# Altium schematic sheet 31_Radar_VPP_service.SchDoc
size 289 x 396 mm
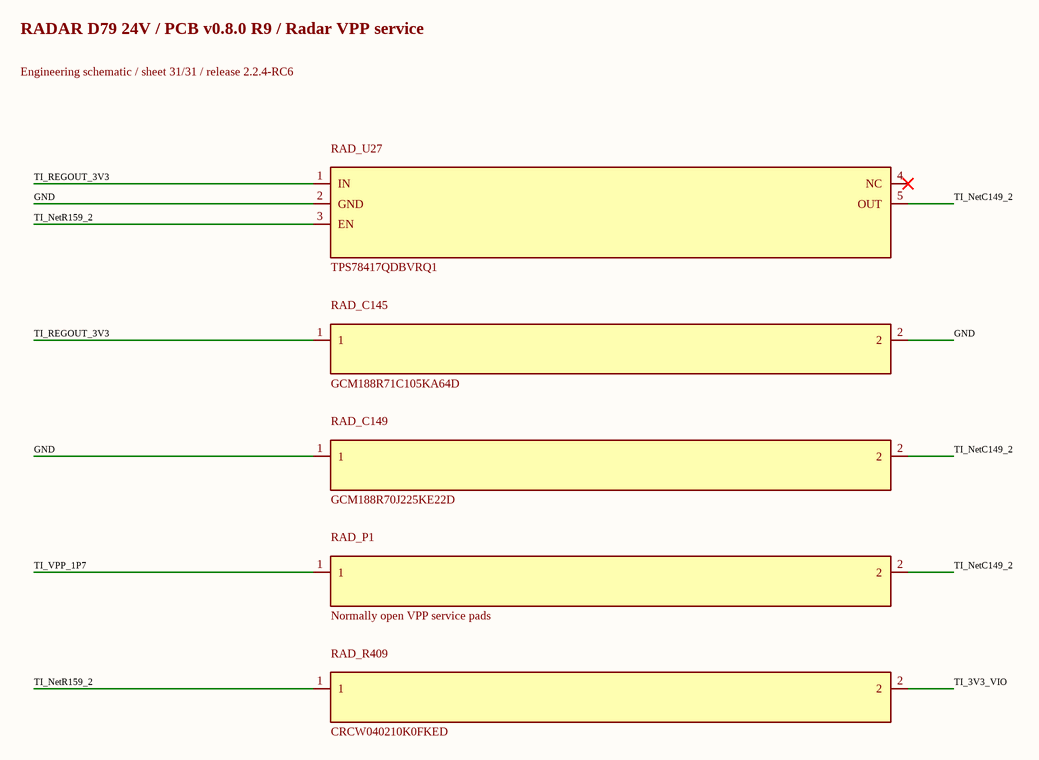
[diagram p0: 31_Radar_VPP_service.SchDoc]

## Parts
RAD_C145  GCM188R71C105KA64D  [0603L]
RAD_C149  GCM188R70J225KE22D  [0603L]
RAD_P1  Normally open VPP service pads  [VPP_SERVICE_SMT_D1p5_P2p5]
RAD_R409  CRCW040210K0FKED  [0402L]
RAD_U27  TPS78417QDBVRQ1  [DBV0005A-MFG]

## Nets
GND: RAD_C145.2 RAD_C149.1 RAD_U27.2(GND)
TI_3V3_VIO: RAD_R409.2
TI_NetC149_2: RAD_C149.2 RAD_P1.2 RAD_U27.5(OUT)
TI_NetR159_2: RAD_R409.1 RAD_U27.3(EN)
TI_REGOUT_3V3: RAD_C145.1 RAD_U27.1(IN)
TI_VPP_1P7: RAD_P1.1

Not connected (* = marked no-connect by the designer): RAD_U27 4(NC)*

## Notes on the sheet
- RADAR D79 24V / PCB v0.8.0 R9 / Radar VPP service
- Engineering schematic / sheet 31/31 / release 2.2.4-RC6